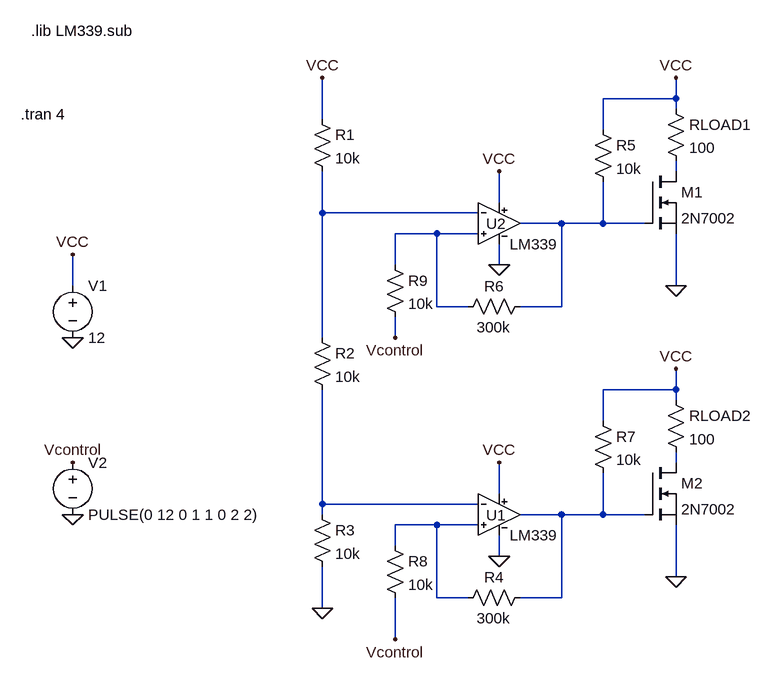
[diagram p0: schematic relay_control_module.asc]
relay_control_module.asc, the LTspice schematic file:
Version 4
SHEET 1 2216 3296
WIRE -448 -320 -448 -352
WIRE -448 -320 -560 -320
WIRE -448 -304 -448 -320
WIRE -992 -288 -992 -352
WIRE -560 -272 -560 -320
WIRE -448 -208 -448 -224
WIRE -720 -160 -720 -208
WIRE -992 -144 -992 -208
WIRE -752 -144 -992 -144
WIRE -624 -128 -688 -128
WIRE -560 -128 -560 -192
WIRE -560 -128 -624 -128
WIRE -496 -128 -560 -128
WIRE -816 -112 -880 -112
WIRE -752 -112 -816 -112
WIRE -880 -64 -880 -112
WIRE -720 -64 -720 -96
WIRE -1376 -32 -1376 -80
WIRE -448 -32 -448 -112
WIRE -816 0 -816 -112
WIRE -768 0 -816 0
WIRE -624 0 -624 -128
WIRE -624 0 -688 0
WIRE -992 48 -992 -144
WIRE -880 48 -880 16
WIRE -448 128 -448 96
WIRE -448 128 -560 128
WIRE -448 144 -448 128
WIRE -560 176 -560 128
WIRE -448 240 -448 224
WIRE -720 288 -720 240
WIRE -992 304 -992 128
WIRE -752 304 -992 304
WIRE -992 320 -992 304
WIRE -624 320 -688 320
WIRE -560 320 -560 256
WIRE -560 320 -624 320
WIRE -496 320 -560 320
WIRE -816 336 -880 336
WIRE -752 336 -816 336
WIRE -880 368 -880 336
WIRE -720 384 -720 352
WIRE -448 416 -448 336
WIRE -816 448 -816 336
WIRE -768 448 -816 448
WIRE -624 448 -624 320
WIRE -624 448 -688 448
WIRE -992 464 -992 400
WIRE -880 512 -880 448
FLAG -1376 48 0
FLAG -1376 -80 VCC
FLAG -720 240 VCC
FLAG -720 384 0
FLAG -992 -352 VCC
FLAG -992 464 0
FLAG -448 416 0
FLAG -448 96 VCC
FLAG -720 -208 VCC
FLAG -720 -64 0
FLAG -448 -32 0
FLAG -448 -352 VCC
FLAG -1376 320 0
FLAG -1376 240 Vcontrol
FLAG -880 48 Vcontrol
FLAG -880 512 Vcontrol
SYMBOL LM339 -720 320 R0
WINDOW 0 -20 1 Left 2
SYMATTR InstName U1
SYMATTR SpiceModel LM339
SYMBOL voltage -1376 -48 R0
SYMATTR InstName V1
SYMATTR Value 12
SYMBOL Res -1008 -304 R0
SYMATTR InstName R1
SYMATTR Value 10k
SYMBOL Res -1008 32 R0
SYMATTR InstName R2
SYMATTR Value 10k
SYMBOL Res -1008 304 R0
SYMATTR InstName R3
SYMATTR Value 10k
SYMBOL Res -672 432 R90
WINDOW 0 0 56 VBottom 2
WINDOW 3 32 56 VTop 2
SYMATTR InstName R4
SYMATTR Value 300k
SYMBOL Res -464 128 R0
SYMATTR InstName RLOAD2
SYMATTR Value 100
SYMBOL LM339 -720 -128 R0
WINDOW 0 -20 1 Left 2
SYMATTR InstName U2
SYMATTR SpiceModel LM339
SYMBOL Res -672 -16 R90
WINDOW 0 0 56 VBottom 2
WINDOW 3 32 56 VTop 2
SYMATTR InstName R6
SYMATTR Value 300k
SYMBOL Res -464 -320 R0
SYMATTR InstName RLOAD1
SYMATTR Value 100
SYMBOL voltage -1376 224 R0
SYMATTR InstName V2
SYMATTR Value PULSE(0 12 0 1 1 0 2 2)
SYMBOL nmos -496 -208 R0
SYMATTR InstName M1
SYMATTR Value 2N7002
SYMBOL nmos -496 240 R0
SYMATTR InstName M2
SYMATTR Value 2N7002
SYMBOL Res -576 -288 R0
SYMATTR InstName R5
SYMATTR Value 10k
SYMBOL Res -576 160 R0
SYMATTR InstName R7
SYMATTR Value 10k
SYMBOL Res -896 352 R0
SYMATTR InstName R8
SYMATTR Value 10k
SYMBOL Res -896 -80 R0
SYMATTR InstName R9
SYMATTR Value 10k
TEXT -1456 -296 Left 2 !.tran 4
TEXT -1440 -424 Left 2 !.lib LM339.sub

The netlist it stands for:
* relay_control_module.asc
XU1 N008 N006 VCC 0 N007 LM339 LM339  ; pins In+ In- V+ V- OUT
V1 VCC 0 12
R1 VCC N002 10k
R2 N002 N006 10k
R3 N006 0 10k
R4 N007 N008 300k
RLOAD2 VCC N005 100
XU2 N004 N002 VCC 0 N003 LM339 LM339  ; pins In+ In- V+ V- OUT
R6 N003 N004 300k
RLOAD1 VCC N001 100
V2 Vcontrol 0 PULSE(0 12 0 1 1 0 2 2)
M1 N001 N003 0 0 2N7002
M2 N005 N007 0 0 2N7002
R5 VCC N003 10k
R7 VCC N007 10k
R8 N008 Vcontrol 10k
R9 N004 Vcontrol 10k
.model NMOS NMOS
.model PMOS PMOS
.lib standard.mos
.tran 4
.lib LM339.sub
.backanno
.end